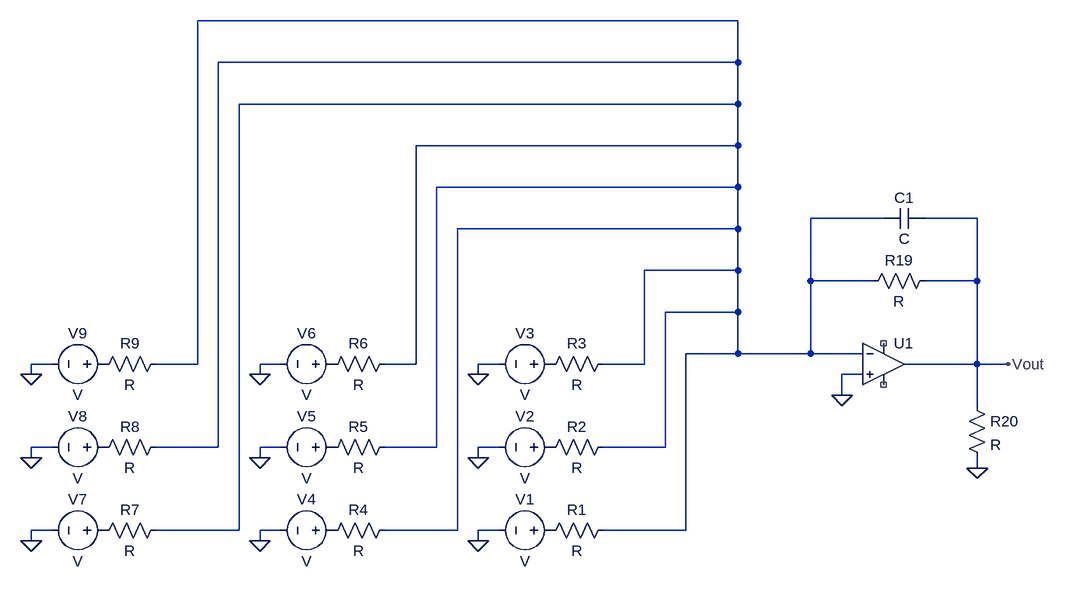
[diagram p0: schematic analog_neuron.asc]
analog_neuron.asc, the LTspice schematic file:
Version 4.1
SHEET 1 880 680
WIRE 352 -592 -480 -592
WIRE 352 -528 352 -592
WIRE 352 -528 -448 -528
WIRE 352 -464 352 -528
WIRE 352 -464 -416 -464
WIRE 352 -400 352 -464
WIRE 352 -400 -144 -400
WIRE 352 -336 352 -400
WIRE 352 -336 -112 -336
WIRE 576 -288 464 -288
WIRE 720 -288 640 -288
WIRE 352 -272 352 -336
WIRE 352 -272 -80 -272
WIRE 352 -208 352 -272
WIRE 352 -208 208 -208
WIRE 464 -192 464 -288
WIRE 560 -192 464 -192
WIRE 720 -192 720 -288
WIRE 720 -192 640 -192
WIRE 352 -144 352 -208
WIRE 352 -144 240 -144
WIRE 352 -80 352 -144
WIRE 352 -80 272 -80
WIRE 464 -80 464 -192
WIRE 464 -80 352 -80
WIRE 544 -80 464 -80
WIRE -704 -64 -736 -64
WIRE -480 -64 -480 -592
WIRE -480 -64 -544 -64
WIRE -352 -64 -384 -64
WIRE -144 -64 -144 -400
WIRE -144 -64 -192 -64
WIRE -16 -64 -48 -64
WIRE 208 -64 208 -208
WIRE 208 -64 144 -64
WIRE 720 -64 720 -192
WIRE 720 -64 608 -64
WIRE 768 -64 720 -64
WIRE -736 -48 -736 -64
WIRE -384 -48 -384 -64
WIRE -48 -48 -48 -64
WIRE 544 -48 512 -48
WIRE 512 -16 512 -48
WIRE 720 0 720 -64
WIRE -704 64 -736 64
WIRE -448 64 -448 -528
WIRE -448 64 -544 64
WIRE -352 64 -384 64
WIRE -112 64 -112 -336
WIRE -112 64 -192 64
WIRE -16 64 -48 64
WIRE 240 64 240 -144
WIRE 240 64 144 64
WIRE -736 80 -736 64
WIRE -384 80 -384 64
WIRE -48 80 -48 64
WIRE 720 96 720 80
WIRE -704 192 -736 192
WIRE -416 192 -416 -464
WIRE -416 192 -544 192
WIRE -352 192 -384 192
WIRE -80 192 -80 -272
WIRE -80 192 -192 192
WIRE -16 192 -48 192
WIRE 272 192 272 -80
WIRE 272 192 144 192
WIRE -736 208 -736 192
WIRE -384 208 -384 192
WIRE -48 208 -48 192
FLAG -48 208 0
FLAG -48 80 0
FLAG -48 -48 0
FLAG -384 208 0
FLAG -384 80 0
FLAG -384 -48 0
FLAG -736 208 0
FLAG -736 80 0
FLAG -736 -48 0
FLAG 512 -16 0
FLAG 720 96 0
FLAG 768 -64 Vout
SYMBOL res 48 208 R270
WINDOW 0 32 56 VTop 2
WINDOW 3 0 56 VBottom 2
SYMATTR InstName R1
SYMBOL voltage 80 192 R90
WINDOW 0 -32 56 VBottom 2
WINDOW 3 32 56 VTop 2
SYMATTR InstName V1
SYMBOL res 48 80 R270
WINDOW 0 32 56 VTop 2
WINDOW 3 0 56 VBottom 2
SYMATTR InstName R2
SYMBOL voltage 80 64 R90
WINDOW 0 -32 56 VBottom 2
WINDOW 3 32 56 VTop 2
SYMATTR InstName V2
SYMBOL res 48 -48 R270
WINDOW 0 32 56 VTop 2
WINDOW 3 0 56 VBottom 2
SYMATTR InstName R3
SYMBOL voltage 80 -64 R90
WINDOW 0 -32 56 VBottom 2
WINDOW 3 32 56 VTop 2
SYMATTR InstName V3
SYMBOL res -288 208 R270
WINDOW 0 32 56 VTop 2
WINDOW 3 0 56 VBottom 2
SYMATTR InstName R4
SYMBOL voltage -256 192 R90
WINDOW 0 -32 56 VBottom 2
WINDOW 3 32 56 VTop 2
SYMATTR InstName V4
SYMBOL res -288 80 R270
WINDOW 0 32 56 VTop 2
WINDOW 3 0 56 VBottom 2
SYMATTR InstName R5
SYMBOL voltage -256 64 R90
WINDOW 0 -32 56 VBottom 2
WINDOW 3 32 56 VTop 2
SYMATTR InstName V5
SYMBOL res -288 -48 R270
WINDOW 0 32 56 VTop 2
WINDOW 3 0 56 VBottom 2
SYMATTR InstName R6
SYMBOL voltage -256 -64 R90
WINDOW 0 -32 56 VBottom 2
WINDOW 3 32 56 VTop 2
SYMATTR InstName V6
SYMBOL res -640 208 R270
WINDOW 0 32 56 VTop 2
WINDOW 3 0 56 VBottom 2
SYMATTR InstName R7
SYMBOL voltage -608 192 R90
WINDOW 0 -32 56 VBottom 2
WINDOW 3 32 56 VTop 2
SYMATTR InstName V7
SYMBOL res -640 80 R270
WINDOW 0 32 56 VTop 2
WINDOW 3 0 56 VBottom 2
SYMATTR InstName R8
SYMBOL voltage -608 64 R90
WINDOW 0 -32 56 VBottom 2
WINDOW 3 32 56 VTop 2
SYMATTR InstName V8
SYMBOL res -640 -48 R270
WINDOW 0 32 56 VTop 2
WINDOW 3 0 56 VBottom 2
SYMATTR InstName R9
SYMBOL voltage -608 -64 R90
WINDOW 0 -32 56 VBottom 2
WINDOW 3 32 56 VTop 2
SYMATTR InstName V9
SYMBOL cap 576 -272 R270
WINDOW 0 32 32 VTop 2
WINDOW 3 0 32 VBottom 2
SYMATTR InstName C1
SYMBOL res 544 -176 R270
WINDOW 0 32 56 VTop 2
WINDOW 3 0 56 VBottom 2
SYMATTR InstName R19
SYMBOL OpAmps\\UniversalOpAmp 576 -64 R0
SYMATTR InstName U1
SYMBOL res 704 -16 R0
SYMATTR InstName R20

The netlist it stands for:
* analog_neuron.asc
R1 P001 N001 R
V1 P001 0 V
R2 P002 N001 R
V2 P002 0 V
R3 P003 N001 R
V3 P003 0 V
R4 P004 N001 R
V4 P004 0 V
R5 P005 N001 R
V5 P005 0 V
R6 P006 N001 R
V6 P006 0 V
R7 P007 N001 R
V7 P007 0 V
R8 P008 N001 R
V8 P008 0 V
R9 P009 N001 R
V9 P009 0 V
C1 N001 Vout C
R19 N001 Vout R
X§U1 0 N001 NC_01 NC_02 Vout level1 Avol=1Meg GBW=10Meg Vos=0 En=0 Enk=0 In=0 Ink=0 Rin=500Meg  ; pins In+ In- V+ V- OUT
R20 Vout 0 R
.lib UniversalOpAmp1.lib
.backanno
.end